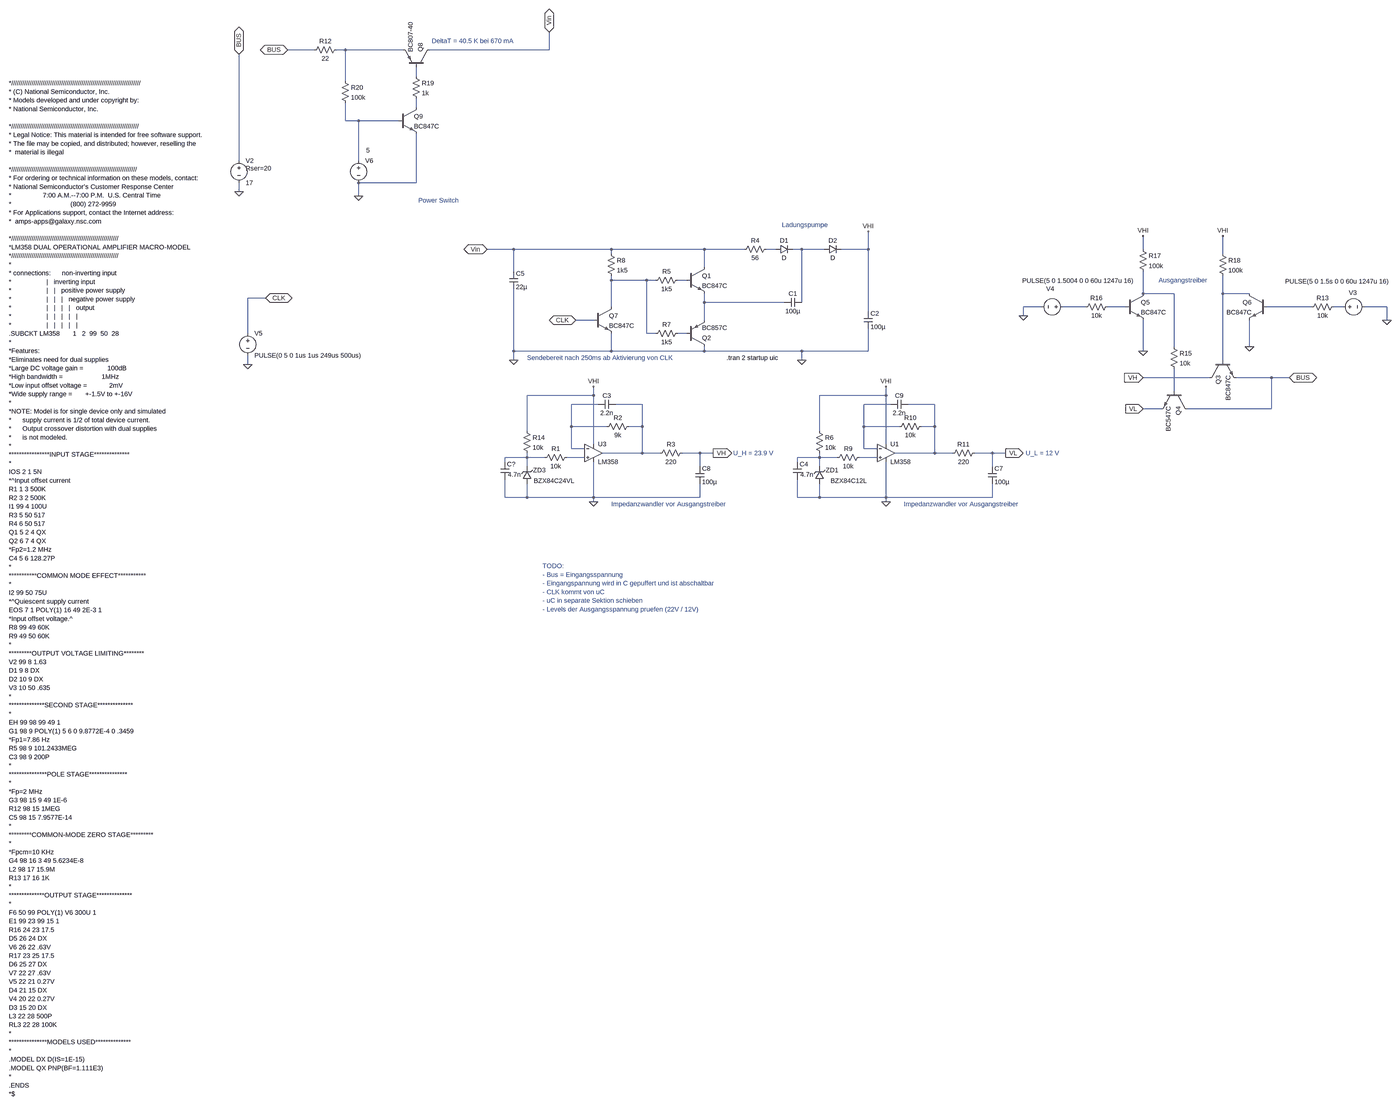
[diagram p0: schematic DriverC9.asc, whole sheet]
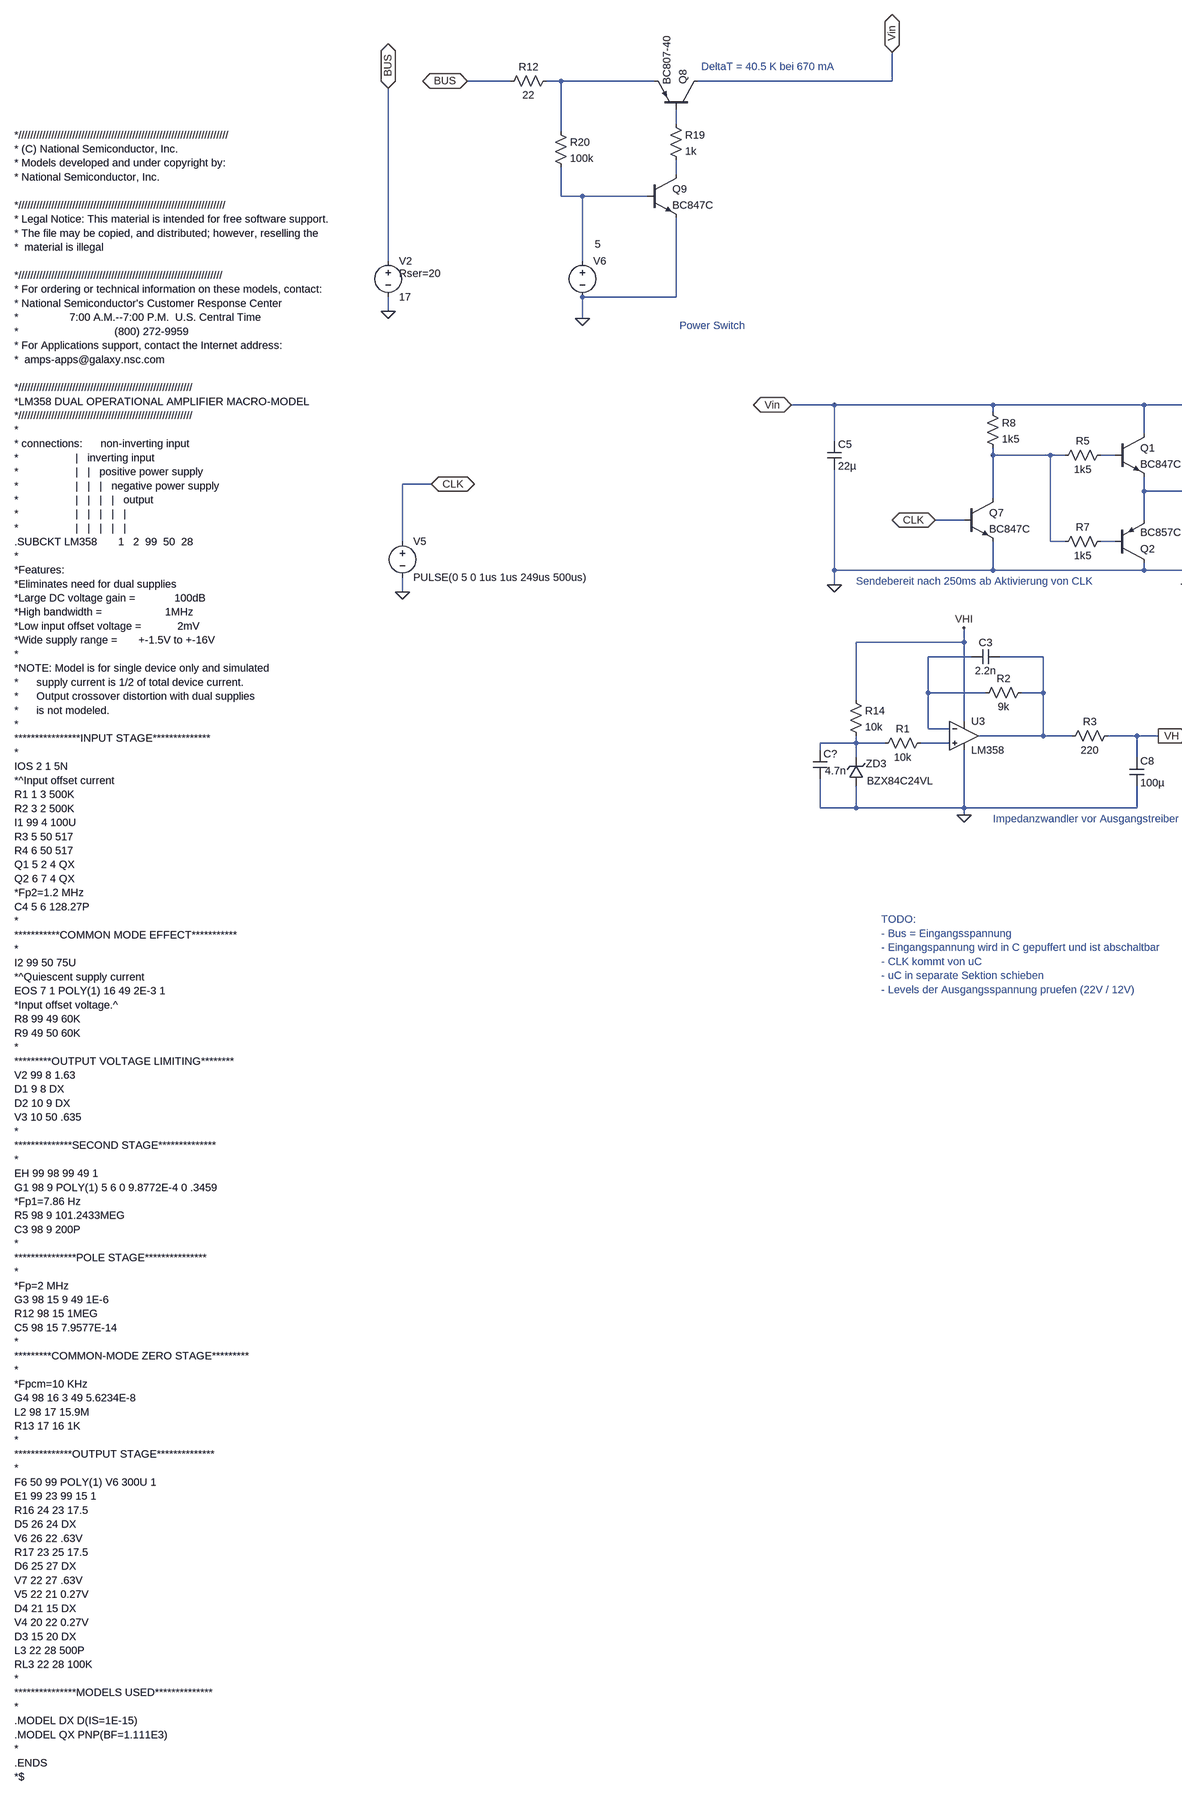
[diagram p1: schematic DriverC9.asc, part, row 1 of 1, column 1 of 2]
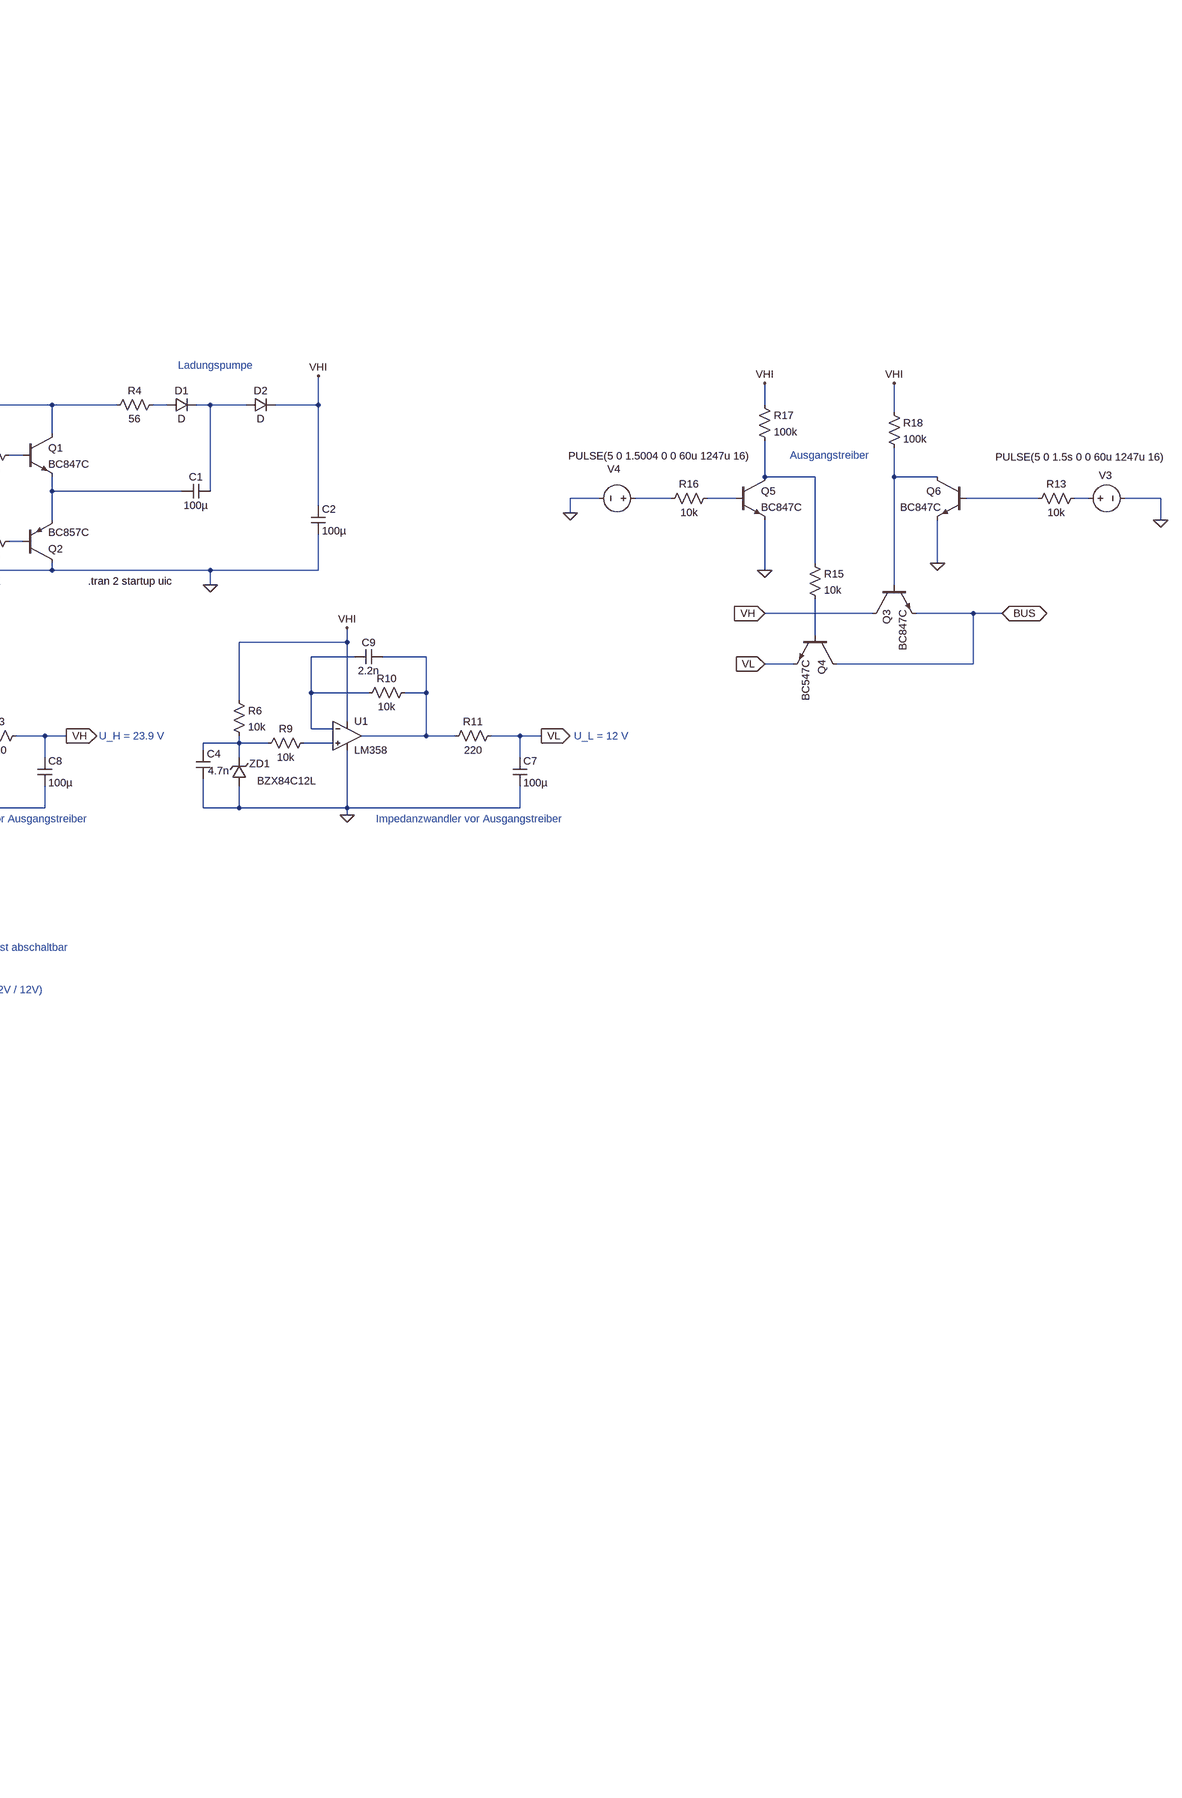
[diagram p2: schematic DriverC9.asc, part, row 1 of 1, column 2 of 2]
DriverC9.asc, the LTspice schematic file:
Version 4
SHEET 1 2516 2612
WIRE -1488 -800 -1584 -800
WIRE -1376 -800 -1408 -800
WIRE -1168 -800 -1376 -800
WIRE -640 -800 -640 -864
WIRE -640 -800 -1072 -800
WIRE -1120 -704 -1120 -736
WIRE -1376 -688 -1376 -800
WIRE -1120 -592 -1120 -624
WIRE -1376 -544 -1376 -608
WIRE -1328 -544 -1376 -544
WIRE -1184 -544 -1328 -544
WIRE -1760 -400 -1760 -784
WIRE -1328 -400 -1328 -544
WIRE -1120 -320 -1120 -496
WIRE -1120 -320 -1328 -320
WIRE -1760 -288 -1760 -320
WIRE -1328 -272 -1328 -320
WIRE -768 -80 -864 -80
WIRE -416 -80 -768 -80
WIRE -80 -80 -416 -80
WIRE 64 -80 -80 -80
WIRE 176 -80 144 -80
WIRE 272 -80 240 -80
WIRE 352 -80 272 -80
WIRE 512 -80 512 -144
WIRE 512 -80 416 -80
WIRE 1504 -80 1504 -128
WIRE -416 -64 -416 -80
WIRE 1792 -64 1792 -128
WIRE -80 -16 -80 -80
WIRE -768 0 -768 -80
WIRE -416 32 -416 16
WIRE -288 32 -416 32
WIRE -256 32 -288 32
WIRE -144 32 -176 32
WIRE 1504 80 1504 0
WIRE 1616 80 1504 80
WIRE 1792 80 1792 16
WIRE 1888 80 1792 80
WIRE -1664 96 -1728 96
WIRE -80 112 -80 80
WIRE 208 112 -80 112
WIRE 272 112 272 -80
WIRE -416 128 -416 32
WIRE 1136 128 1072 128
WIRE 1296 128 1216 128
WIRE 1440 128 1376 128
WIRE 2112 128 1952 128
WIRE 2224 128 2192 128
WIRE 2384 128 2304 128
WIRE 512 144 512 -80
WIRE 1072 160 1072 128
WIRE -480 176 -544 176
WIRE -80 176 -80 112
WIRE 2384 176 2384 128
WIRE -1728 224 -1728 96
WIRE -288 224 -288 32
WIRE -256 224 -288 224
WIRE -144 224 -176 224
WIRE 1616 272 1616 80
WIRE 1888 272 1888 176
WIRE -768 288 -768 64
WIRE -416 288 -416 224
WIRE -416 288 -768 288
WIRE -80 288 -80 272
WIRE -80 288 -416 288
WIRE 272 288 -80 288
WIRE 512 288 512 208
WIRE 512 288 272 288
WIRE 1504 288 1504 176
WIRE -768 320 -768 288
WIRE 272 320 272 288
WIRE 1792 320 1792 80
WIRE -1728 336 -1728 304
WIRE 1744 384 1504 384
WIRE 1968 384 1840 384
WIRE 2032 384 1968 384
WIRE 1616 432 1616 352
WIRE -480 448 -480 416
WIRE -480 448 -720 448
WIRE 576 448 576 416
WIRE 576 448 336 448
WIRE -464 480 -560 480
WIRE -304 480 -400 480
WIRE 592 480 496 480
WIRE 752 480 656 480
WIRE 1568 496 1504 496
WIRE 1968 496 1968 384
WIRE 1968 496 1664 496
WIRE -560 560 -560 480
WIRE -432 560 -560 560
WIRE -304 560 -304 480
WIRE -304 560 -352 560
WIRE 496 560 496 480
WIRE 624 560 496 560
WIRE 752 560 752 480
WIRE 752 560 704 560
WIRE -720 576 -720 448
WIRE 336 576 336 448
WIRE -480 624 -480 448
WIRE 576 624 576 448
WIRE -560 640 -560 560
WIRE -512 640 -560 640
WIRE 496 640 496 560
WIRE 544 640 496 640
WIRE -304 656 -304 560
WIRE -304 656 -448 656
WIRE -240 656 -304 656
WIRE -96 656 -160 656
WIRE -48 656 -96 656
WIRE 752 656 752 560
WIRE 752 656 608 656
WIRE 816 656 752 656
WIRE 960 656 896 656
WIRE 1008 656 960 656
WIRE -720 672 -720 656
WIRE -720 672 -800 672
WIRE -656 672 -720 672
WIRE -512 672 -576 672
WIRE 336 672 336 656
WIRE 336 672 256 672
WIRE 400 672 336 672
WIRE 544 672 480 672
WIRE -800 688 -800 672
WIRE 256 688 256 672
WIRE -720 704 -720 672
WIRE -96 704 -96 656
WIRE 336 704 336 672
WIRE 960 704 960 656
WIRE -800 816 -800 752
WIRE -720 816 -720 768
WIRE -720 816 -800 816
WIRE -480 816 -480 688
WIRE -480 816 -720 816
WIRE -96 816 -96 768
WIRE -96 816 -480 816
WIRE 256 816 256 752
WIRE 336 816 336 768
WIRE 336 816 256 816
WIRE 576 816 576 688
WIRE 576 816 336 816
WIRE 960 816 960 768
WIRE 960 816 576 816
WIRE -480 832 -480 816
WIRE 576 832 576 816
FLAG 272 320 0
FLAG -544 176 CLK
IOPIN -544 176 BiDir
FLAG 512 -144 VHI
FLAG -48 656 VH
IOPIN -48 656 Out
FLAG -480 416 VHI
FLAG -480 832 0
FLAG 1008 656 VL
IOPIN 1008 656 Out
FLAG 576 416 VHI
FLAG 576 832 0
FLAG 2384 176 0
FLAG 1504 496 VL
IOPIN 1504 496 In
FLAG 1504 384 VH
IOPIN 1504 384 In
FLAG 1504 -128 VHI
FLAG 1072 160 0
FLAG 1504 288 0
FLAG 1792 -128 VHI
FLAG 1888 272 0
FLAG -1728 336 0
FLAG -1664 96 CLK
IOPIN -1664 96 BiDir
FLAG -1760 -288 0
FLAG -1760 -784 BUS
IOPIN -1760 -784 BiDir
FLAG -1328 -272 0
FLAG -640 -864 Vin
IOPIN -640 -864 BiDir
FLAG -864 -80 Vin
IOPIN -864 -80 BiDir
FLAG -768 320 0
FLAG -1584 -800 BUS
IOPIN -1584 -800 BiDir
FLAG 2032 384 BUS
IOPIN 2032 384 BiDir
SYMBOL diode 176 -64 R270
WINDOW 0 32 32 VTop 2
WINDOW 3 0 32 VBottom 2
SYMATTR InstName D1
SYMBOL diode 352 -64 R270
WINDOW 0 32 32 VTop 2
WINDOW 3 0 32 VBottom 2
SYMATTR InstName D2
SYMBOL cap 272 96 R90
WINDOW 0 0 32 VBottom 2
WINDOW 3 32 32 VTop 2
SYMATTR InstName C1
SYMATTR Value 100µ
SYMBOL cap 496 144 R0
SYMATTR InstName C2
SYMATTR Value 100µ
SYMBOL res 160 -96 R90
WINDOW 0 0 56 VBottom 2
WINDOW 3 32 56 VTop 2
SYMATTR InstName R4
SYMATTR Value 56
SYMBOL Opamps\\opamp2 -480 592 R0
SYMATTR InstName U3
SYMATTR Value LM358
SYMATTR SpiceModel LM358
SYMBOL res -736 560 R0
SYMATTR InstName R14
SYMATTR Value 10k
SYMBOL cap -816 688 R0
WINDOW 3 27 46 Left 2
SYMATTR Value 4.7n
SYMATTR InstName C?
SYMBOL res -560 656 R90
WINDOW 0 0 56 VBottom 2
WINDOW 3 32 56 VTop 2
SYMATTR InstName R1
SYMATTR Value 10k
SYMBOL res -336 544 R90
WINDOW 0 0 56 VBottom 2
WINDOW 3 32 56 VTop 2
SYMATTR InstName R2
SYMATTR Value 9k
SYMBOL cap -112 704 R0
SYMATTR InstName C8
SYMATTR Value 100µ
SYMBOL res -144 640 R90
WINDOW 0 0 56 VBottom 2
WINDOW 3 32 56 VTop 2
SYMATTR InstName R3
SYMATTR Value 220
SYMBOL cap -400 464 R90
WINDOW 0 0 32 VBottom 2
WINDOW 3 32 32 VTop 2
SYMATTR InstName C3
SYMATTR Value 2.2n
SYMBOL zener -704 768 R180
WINDOW 0 -52 50 Left 2
WINDOW 3 -155 12 Left 2
SYMATTR InstName ZD3
SYMATTR Value BZX84C24VL
SYMBOL Opamps\\opamp2 576 592 R0
SYMATTR InstName U1
SYMATTR Value LM358
SYMATTR SpiceModel LM358
SYMBOL res 320 560 R0
SYMATTR InstName R6
SYMATTR Value 10k
SYMBOL cap 240 688 R0
WINDOW 3 27 46 Left 2
SYMATTR Value 4.7n
SYMATTR InstName C4
SYMBOL res 496 656 R90
WINDOW 0 0 56 VBottom 2
WINDOW 3 32 56 VTop 2
SYMATTR InstName R9
SYMATTR Value 10k
SYMBOL res 720 544 R90
WINDOW 0 0 56 VBottom 2
WINDOW 3 32 56 VTop 2
SYMATTR InstName R10
SYMATTR Value 10k
SYMBOL cap 944 704 R0
SYMATTR InstName C7
SYMATTR Value 100µ
SYMBOL res 912 640 R90
WINDOW 0 0 56 VBottom 2
WINDOW 3 32 56 VTop 2
SYMATTR InstName R11
SYMATTR Value 220
SYMBOL cap 656 464 R90
WINDOW 0 0 32 VBottom 2
WINDOW 3 32 32 VTop 2
SYMATTR InstName C9
SYMATTR Value 2.2n
SYMBOL zener 352 768 R180
WINDOW 0 -52 50 Left 2
WINDOW 3 -155 12 Left 2
SYMATTR InstName ZD1
SYMATTR Value BZX84C12L
SYMBOL voltage 2208 128 M90
WINDOW 0 -51 68 VLeft 2
WINDOW 3 -92 185 VLeft 2
WINDOW 123 0 0 Left 0
WINDOW 39 0 0 Left 0
SYMATTR InstName V3
SYMATTR Value PULSE(5 0 1.5s 0 0 60u 1247u 16)
SYMBOL npn 1744 320 M90
SYMATTR InstName Q3
SYMATTR Value BC847C
SYMBOL res 2208 112 R90
WINDOW 0 0 56 VBottom 2
WINDOW 3 32 56 VTop 2
SYMATTR InstName R13
SYMATTR Value 10k
SYMBOL voltage 1232 128 M270
WINDOW 0 65 78 VLeft 2
WINDOW 3 94 164 VLeft 2
WINDOW 123 0 0 Left 0
WINDOW 39 0 0 Left 0
SYMATTR InstName V4
SYMATTR Value PULSE(5 0 1.5004 0 0 60u 1247u 16)
SYMBOL res 1600 256 R0
SYMATTR InstName R15
SYMATTR Value 10k
SYMBOL npn 1664 432 R90
SYMATTR InstName Q4
SYMATTR Value BC547C
SYMBOL npn 1440 80 R0
SYMATTR InstName Q5
SYMATTR Value BC847C
SYMBOL res 1392 112 R90
WINDOW 0 0 56 VBottom 2
WINDOW 3 32 56 VTop 2
SYMATTR InstName R16
SYMATTR Value 10k
SYMBOL res 1488 -96 R0
SYMATTR InstName R17
SYMATTR Value 100k
SYMBOL npn 1952 80 M0
SYMATTR InstName Q6
SYMATTR Value BC847C
SYMBOL res 1776 -80 R0
SYMATTR InstName R18
SYMATTR Value 100k
SYMBOL npn -144 -16 R0
SYMATTR InstName Q1
SYMATTR Value BC847C
SYMBOL pnp -144 272 M180
SYMATTR InstName Q2
SYMATTR Value BC857C
SYMBOL npn -480 128 R0
SYMATTR InstName Q7
SYMATTR Value BC847C
SYMBOL res -160 16 R90
WINDOW 0 0 56 VBottom 2
WINDOW 3 32 56 VTop 2
SYMATTR InstName R5
SYMATTR Value 1k5
SYMBOL res -160 208 R90
WINDOW 0 0 56 VBottom 2
WINDOW 3 32 56 VTop 2
SYMATTR InstName R7
SYMATTR Value 1k5
SYMBOL res -432 -80 R0
SYMATTR InstName R8
SYMATTR Value 1k5
SYMBOL voltage -1728 208 R0
WINDOW 123 0 0 Left 0
WINDOW 39 0 0 Left 0
SYMATTR InstName V5
SYMATTR Value PULSE(0 5 0 1us 1us 249us 500us)
SYMBOL cap -784 0 R0
SYMATTR InstName C5
SYMATTR Value 22µ
SYMBOL voltage -1760 -416 R0
WINDOW 123 0 0 Left 0
WINDOW 39 24 44 Left 2
SYMATTR SpiceLine Rser=20
SYMATTR InstName V2
SYMATTR Value 17
SYMBOL pnp -1072 -736 M270
SYMATTR InstName Q8
SYMATTR Value BC807-40
SYMBOL npn -1184 -592 R0
SYMATTR InstName Q9
SYMATTR Value BC847C
SYMBOL res -1136 -720 R0
SYMATTR InstName R19
SYMATTR Value 1k
SYMBOL res -1392 -704 R0
SYMATTR InstName R20
SYMATTR Value 100k
SYMBOL voltage -1328 -416 R0
WINDOW 3 27 -21 Left 2
WINDOW 123 0 0 Left 0
WINDOW 39 0 0 Left 0
SYMATTR InstName V6
SYMATTR Value 5
SYMBOL res -1392 -816 R90
WINDOW 0 0 56 VBottom 2
WINDOW 3 32 56 VTop 2
SYMATTR InstName R12
SYMATTR Value 22
TEXT 0 312 Left 2 !.tran 2 startup uic
TEXT 200 -168 Left 2 ;Ladungspumpe
TEXT -664 1064 Left 2 ;TODO: \n- Bus = Eingangsspannung\n- Eingangspannung wird in C gepuffert und ist abschaltbar\n- CLK kommt von uC\n- uC in separate Sektion schieben\n- Levels der Ausgangsspannung pruefen (22V / 12V)
TEXT -2704 -680 Left 2 !*//////////////////////////////////////////////////////////////////////\n* (C) National Semiconductor, Inc.\n* Models developed and under copyright by:\n* National Semiconductor, Inc.  \n \n*/////////////////////////////////////////////////////////////////////\n* Legal Notice: This material is intended for free software support.\n* The file may be copied, and distributed; however, reselling the \n*  material is illegal\n \n*////////////////////////////////////////////////////////////////////\n* For ordering or technical information on these models, contact:\n* National Semiconductor's Customer Response Center\n*                 7:00 A.M.--7:00 P.M.  U.S. Central Time\n*                                (800) 272-9959\n* For Applications support, contact the Internet address:\n*  amps-apps@galaxy.nsc.com\n \n*//////////////////////////////////////////////////////////\n*LM358 DUAL OPERATIONAL AMPLIFIER MACRO-MODEL\n*//////////////////////////////////////////////////////////\n*\n* connections:      non-inverting input\n*                   |   inverting input\n*                   |   |   positive power supply\n*                   |   |   |   negative power supply\n*                   |   |   |   |   output\n*                   |   |   |   |   |\n*                   |   |   |   |   |\n.SUBCKT LM358       1   2  99  50  28\n*\n*Features:\n*Eliminates need for dual supplies\n*Large DC voltage gain =             100dB\n*High bandwidth =                     1MHz\n*Low input offset voltage =            2mV\n*Wide supply range =       +-1.5V to +-16V\n*\n*NOTE: Model is for single device only and simulated\n*      supply current is 1/2 of total device current.\n*      Output crossover distortion with dual supplies\n*      is not modeled.\n*\n****************INPUT STAGE**************\n*\nIOS 2 1 5N\n*^Input offset current\nR1 1 3 500K\nR2 3 2 500K\nI1 99 4 100U\nR3 5 50 517\nR4 6 50 517\nQ1 5 2 4 QX\nQ2 6 7 4 QX\n*Fp2=1.2 MHz\nC4 5 6 128.27P\n*\n***********COMMON MODE EFFECT***********\n*\nI2 99 50 75U\n*^Quiescent supply current\nEOS 7 1 POLY(1) 16 49 2E-3 1\n*Input offset voltage.^\nR8 99 49 60K\nR9 49 50 60K\n*\n*********OUTPUT VOLTAGE LIMITING********\nV2 99 8 1.63\nD1 9 8 DX\nD2 10 9 DX\nV3 10 50 .635\n*\n**************SECOND STAGE**************\n*\nEH 99 98 99 49 1\nG1 98 9 POLY(1) 5 6 0 9.8772E-4 0 .3459\n*Fp1=7.86 Hz\nR5 98 9 101.2433MEG\nC3 98 9 200P\n*\n***************POLE STAGE***************\n*\n*Fp=2 MHz\nG3 98 15 9 49 1E-6\nR12 98 15 1MEG\nC5 98 15 7.9577E-14\n*\n*********COMMON-MODE ZERO STAGE*********\n*\n*Fpcm=10 KHz\nG4 98 16 3 49 5.6234E-8               \nL2 98 17 15.9M\nR13 17 16 1K\n*\n**************OUTPUT STAGE**************\n*\nF6 50 99 POLY(1) V6 300U 1\nE1 99 23 99 15 1\nR16 24 23 17.5\nD5 26 24 DX\nV6 26 22 .63V\nR17 23 25 17.5\nD6 25 27 DX\nV7 22 27 .63V\nV5 22 21 0.27V\nD4 21 15 DX\nV4 20 22 0.27V\nD3 15 20 DX\nL3 22 28 500P\nRL3 22 28 100K\n*\n***************MODELS USED**************\n*\n.MODEL DX D(IS=1E-15)\n.MODEL QX PNP(BF=1.111E3)\n*\n.ENDS\n*$
TEXT 24 656 Left 2 ;U_H = 23.9 V
TEXT -416 840 Left 2 ;Impedanzwandler vor Ausgangstreiber
TEXT 1080 656 Left 2 ;U_L = 12 V
TEXT 640 840 Left 2 ;Impedanzwandler vor Ausgangstreiber
TEXT 1560 32 Left 2 ;Ausgangstreiber
TEXT -720 312 Left 2 ;Sendebereit nach 250ms ab Aktivierung von CLK
TEXT -1064 -832 Left 2 ;DeltaT = 40.5 K bei 670 mA
TEXT -1112 -256 Left 2 ;Power Switch

The netlist it stands for:
* DriverC9.asc
D1 N005 N006 D
D2 N006 VHI D
C1 N006 N011 100µ
C2 VHI 0 100µ
R4 N005 Vin 56
XU3 N023 N018 VHI 0 N019 LM358 LM358  ; pins In+ In- V+ V- OUT
R14 VHI N022 10k
C? N022 0 4.7n
R1 N023 N022 10k
R2 N019 N018 9k
C8 VH 0 100µ
R3 VH N019 220
C3 N019 N018 2.2n
D§ZD3 0 N022 BZX84C24VL
XU1 N025 N020 VHI 0 N021 LM358 LM358  ; pins In+ In- V+ V- OUT
R6 VHI N024 10k
C4 N024 0 4.7n
R9 N025 N024 10k
R10 N021 N020 10k
C7 VL 0 100µ
R11 VL N021 220
C9 N021 N020 2.2n
D§ZD1 0 N024 BZX84C12L
V3 N015 0 PULSE(5 0 1.5s 0 0 60u 1247u 16)
Q3 VH N010 BUS 0 BC847C
R13 N015 N014 10k
V4 N012 0 PULSE(5 0 1.5004 0 0 60u 1247u 16)
R15 N009 N017 10k
Q4 BUS N017 VL 0 BC547C
Q5 N009 N013 0 0 BC847C
R16 N013 N012 10k
R17 VHI N009 100k
Q6 N010 N014 0 0 BC847C
R18 VHI N010 100k
Q1 Vin N008 N011 0 BC847C
Q2 0 N016 N011 0 BC857C
Q7 N007 CLK 0 0 BC847C
R5 N008 N007 1k5
R7 N016 N007 1k5
R8 Vin N007 1k5
V5 CLK 0 PULSE(0 5 0 1us 1us 249us 500us)
C5 Vin 0 22µ
V2 BUS 0 17 Rser=20
Q8 Vin N002 N001 0 BC807-40
Q9 N003 N004 0 0 BC847C
R19 N002 N003 1k
R20 N001 N004 100k
V6 N004 0 5
R12 N001 BUS 22
.model D D
.lib standard.dio
.model NPN NPN
.model PNP PNP
.lib standard.bjt
.tran 2 startup uic
* Ladungspumpe
* TODO:
* - Bus = Eingangsspannung
* - Eingangspannung wird in C gepuffert und ist abschaltbar
* - CLK kommt von uC
* - uC in separate Sektion schieben
* - Levels der Ausgangsspannung pruefen (22V / 12V)
*//////////////////////////////////////////////////////////////////////
* (C) National Semiconductor, Inc.
* Models developed and under copyright by:
* National Semiconductor, Inc.
*/////////////////////////////////////////////////////////////////////
* Legal Notice: This material is intended for free software support.
* The file may be copied, and distributed; however, reselling the
*  material is illegal
*////////////////////////////////////////////////////////////////////
* For ordering or technical information on these models, contact:
* National Semiconductor's Customer Response Center
*                 7:00 A.M.--7:00 P.M.  U.S. Central Time
*                                (800) 272-9959
* For Applications support, contact the Internet address:
*  amps-apps@galaxy.nsc.com
*//////////////////////////////////////////////////////////
*LM358 DUAL OPERATIONAL AMPLIFIER MACRO-MODEL
*//////////////////////////////////////////////////////////
*
* connections:      non-inverting input
*                   |   inverting input
*                   |   |   positive power supply
*                   |   |   |   negative power supply
*                   |   |   |   |   output
*                   |   |   |   |   |
*                   |   |   |   |   |
.SUBCKT LM358       1   2  99  50  28
*
*Features:
*Eliminates need for dual supplies
*Large DC voltage gain =             100dB
*High bandwidth =                     1MHz
*Low input offset voltage =            2mV
*Wide supply range =       +-1.5V to +-16V
*
*NOTE: Model is for single device only and simulated
*      supply current is 1/2 of total device current.
*      Output crossover distortion with dual supplies
*      is not modeled.
*
****************INPUT STAGE**************
*
IOS 2 1 5N
*^Input offset current
R1 1 3 500K
R2 3 2 500K
I1 99 4 100U
R3 5 50 517
R4 6 50 517
Q1 5 2 4 QX
Q2 6 7 4 QX
*Fp2=1.2 MHz
C4 5 6 128.27P
*
***********COMMON MODE EFFECT***********
*
I2 99 50 75U
*^Quiescent supply current
EOS 7 1 POLY(1) 16 49 2E-3 1
*Input offset voltage.^
R8 99 49 60K
R9 49 50 60K
*
*********OUTPUT VOLTAGE LIMITING********
V2 99 8 1.63
D1 9 8 DX
D2 10 9 DX
V3 10 50 .635
*
**************SECOND STAGE**************
*
EH 99 98 99 49 1
G1 98 9 POLY(1) 5 6 0 9.8772E-4 0 .3459
*Fp1=7.86 Hz
R5 98 9 101.2433MEG
C3 98 9 200P
*
***************POLE STAGE***************
*
*Fp=2 MHz
G3 98 15 9 49 1E-6
R12 98 15 1MEG
C5 98 15 7.9577E-14
*
*********COMMON-MODE ZERO STAGE*********
*
*Fpcm=10 KHz
G4 98 16 3 49 5.6234E-8
L2 98 17 15.9M
R13 17 16 1K
*
**************OUTPUT STAGE**************
*
F6 50 99 POLY(1) V6 300U 1
E1 99 23 99 15 1
R16 24 23 17.5
D5 26 24 DX
V6 26 22 .63V
R17 23 25 17.5
D6 25 27 DX
V7 22 27 .63V
V5 22 21 0.27V
D4 21 15 DX
V4 20 22 0.27V
D3 15 20 DX
L3 22 28 500P
RL3 22 28 100K
*
***************MODELS USED**************
*
.MODEL DX D(IS=1E-15)
.MODEL QX PNP(BF=1.111E3)
*
.ENDS
*$
* U_H = 23.9 V
* Impedanzwandler vor Ausgangstreiber
* U_L = 12 V
* Impedanzwandler vor Ausgangstreiber
* Ausgangstreiber
* Sendebereit nach 250ms ab Aktivierung von CLK
* DeltaT = 40.5 K bei 670 mA
* Power Switch
.backanno
.end